# Altium schematic sheet [05] - FLASH MEMORY INTERFACE.SchDoc
size A2; DocumentNumber: 2; SheetNumber: 5; SheetTotal: 10
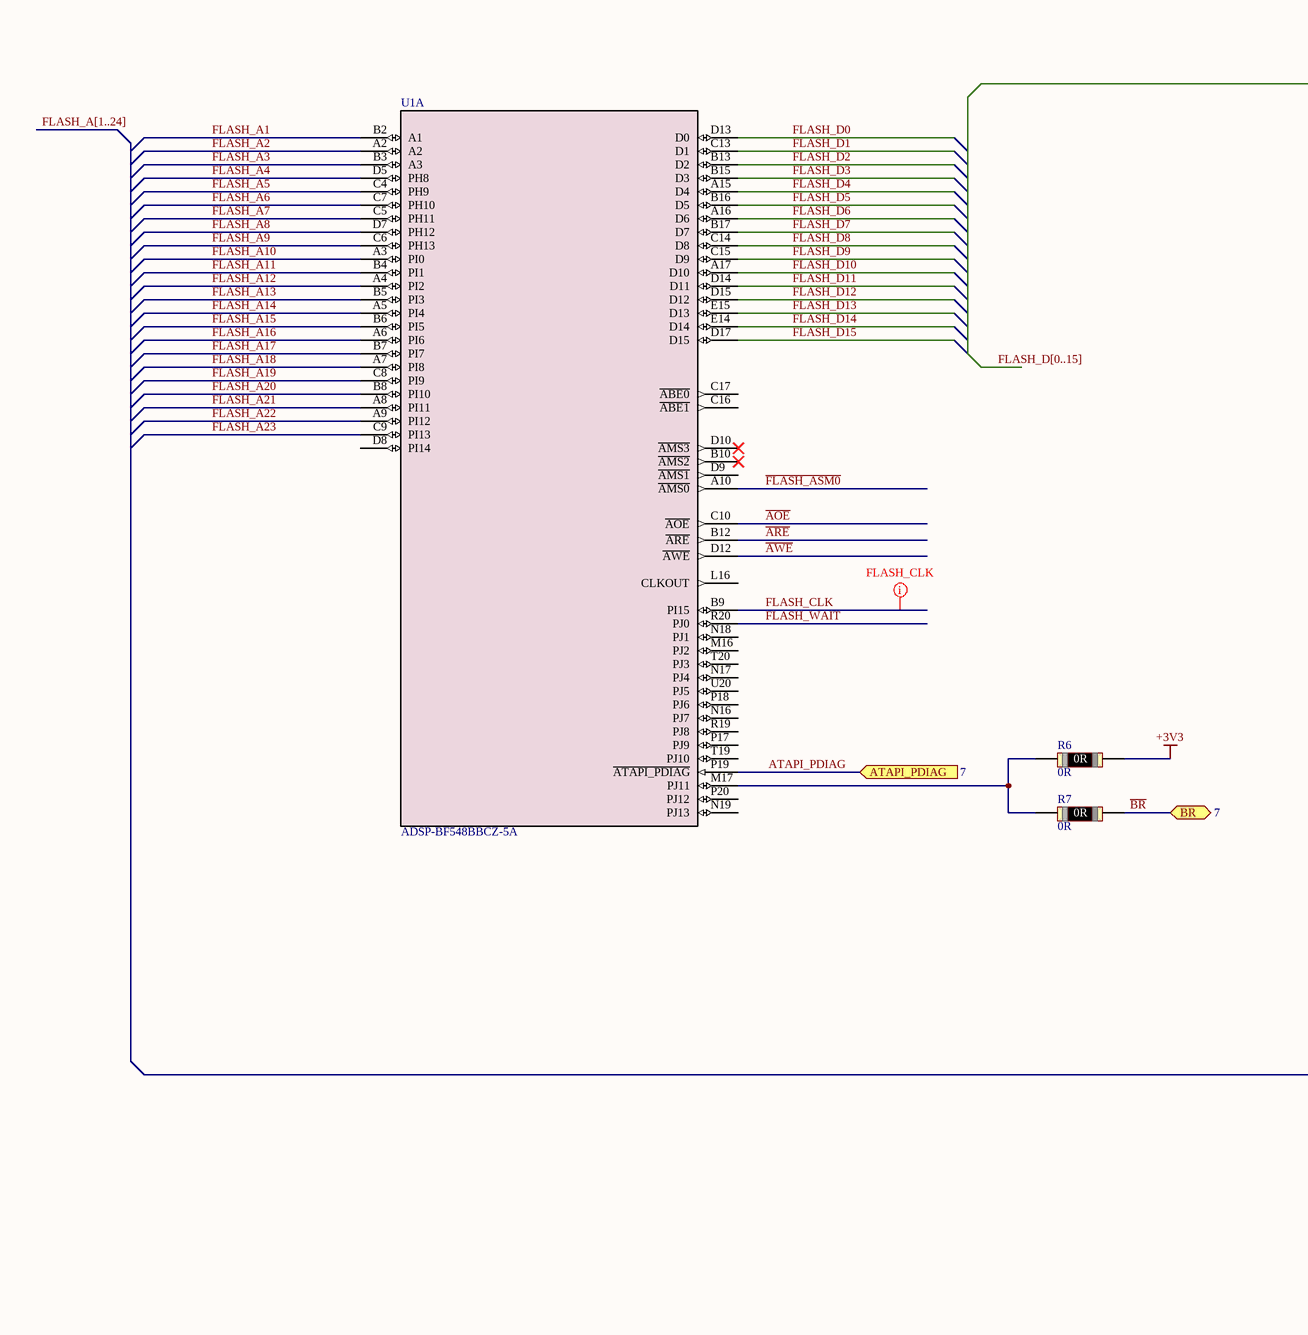
[diagram p0: [05] - FLASH MEMORY INTERFACE.SchDoc, left]
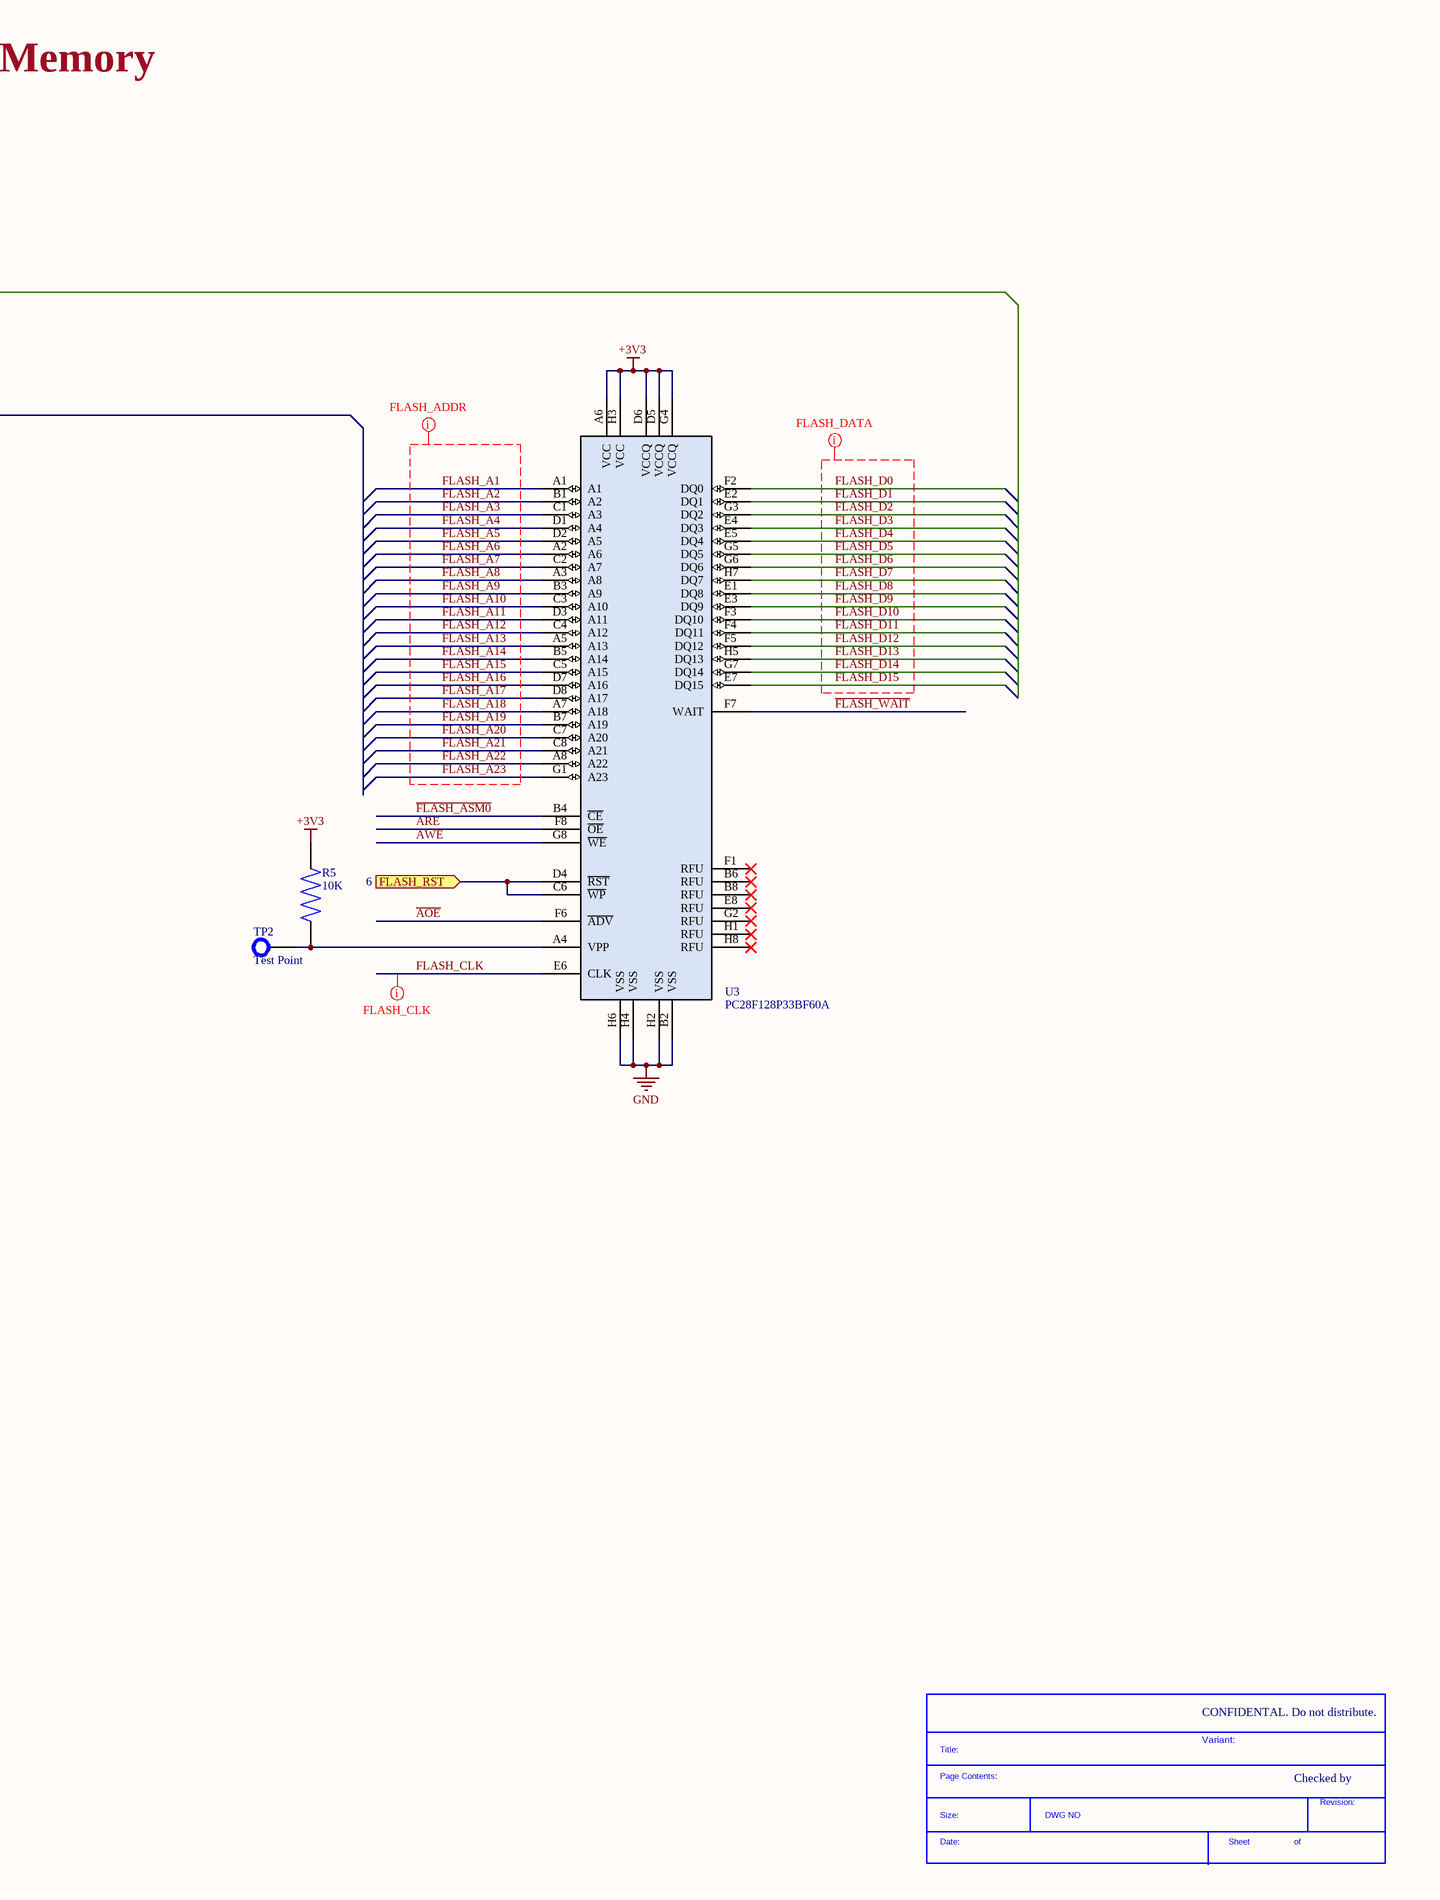
[diagram p1: [05] - FLASH MEMORY INTERFACE.SchDoc, right]

## Parts
*  SDTitleBlock  (value not drawn)  (graphical)
R5  10K  [RES0402]
R6  0R  [RES0402]
R7  0R  [RES0402]
TP2  Test Point  [TP_70MIL]
U1  ADSP-BF548BBCZ-5A  [BC_400_1_ADI]  (part A of 7)
U3  PC28F128P33BF60A  [BGA64_8X10_MRN]

## Ports
ATAPI_PDIAG (in, see 7), BR (bidir, see 7), FLASH_RST (in, see 6)

## Nets
+3V3: R5.2 R6.2 U3.A6(VCC) U3.D5(VCCQ) U3.D6(VCCQ) U3.G4(VCCQ) U3.H3(VCC)
GND: U3.B2(VSS) U3.H2(VSS) U3.H4(VSS) U3.H6(VSS)
~{AOE}: U1.C10(~{AOE}) U3.F6(~{ADV})
~{ARE}: U1.B12(~{ARE}) U3.F8(~{OE})
~{AWE}: U1.D12(~{AWE}) U3.G8(~{WE})
ATAPI_PDIAG: U1.P19(~{ATAPI_PDIAG}) ; port ATAPI_PDIAG
~{BR}: R7.2 ; port BR
~{FLASH_ASM0}: U1.A10(~{AMS0}) U3.B4(~{CE})
~{FLASH_WAIT}: U1.R20(PJ0) U3.F7(WAIT)
FLASH_A1: U1.B2(A1) U3.A1
FLASH_A2: U1.A2 U3.B1(A2)
FLASH_A3: U1.B3(A3) U3.C1(A3)
FLASH_A4: U1.D5(PH8) U3.D1(A4)
FLASH_A5: U1.C4(PH9) U3.D2(A5)
FLASH_A6: U1.C7(PH10) U3.A2(A6)
FLASH_A7: U1.C5(PH11) U3.C2(A7)
FLASH_A8: U1.D7(PH12) U3.A3(A8)
FLASH_A9: U1.C6(PH13) U3.B3(A9)
FLASH_A10: U1.A3(PI0) U3.C3(A10)
FLASH_A11: U1.B4(PI1) U3.D3(A11)
FLASH_A12: U1.A4(PI2) U3.C4(A12)
FLASH_A13: U1.B5(PI3) U3.A5(A13)
FLASH_A14: U1.A5(PI4) U3.B5(A14)
FLASH_A15: U1.B6(PI5) U3.C5(A15)
FLASH_A16: U1.A6(PI6) U3.D7(A16)
FLASH_A17: U1.B7(PI7) U3.D8(A17)
FLASH_A18: U1.A7(PI8) U3.A7(A18)
FLASH_A19: U1.C8(PI9) U3.B7(A19)
FLASH_A20: U1.B8(PI10) U3.C7(A20)
FLASH_A21: U1.A8(PI11) U3.C8(A21)
FLASH_A22: U1.A9(PI12) U3.A8(A22)
FLASH_A23: U1.C9(PI13) U3.G1(A23)
FLASH_CLK: U1.B9(PI15) U3.E6(CLK)
FLASH_D0: U1.D13(D0) U3.F2(DQ0)
FLASH_D1: U1.C13(D1) U3.E2(DQ1)
FLASH_D2: U1.B13(D2) U3.G3(DQ2)
FLASH_D3: U1.B15(D3) U3.E4(DQ3)
FLASH_D4: U1.A15(D4) U3.E5(DQ4)
FLASH_D5: U1.B16(D5) U3.G5(DQ5)
FLASH_D6: U1.A16(D6) U3.G6(DQ6)
FLASH_D7: U1.B17(D7) U3.H7(DQ7)
FLASH_D8: U1.C14(D8) U3.E1(DQ8)
FLASH_D9: U1.C15(D9) U3.E3(DQ9)
FLASH_D10: U1.A17(D10) U3.F3(DQ10)
FLASH_D11: U1.D14(D11) U3.F4(DQ11)
FLASH_D12: U1.D15(D12) U3.F5(DQ12)
FLASH_D13: U1.E15(D13) U3.H5(DQ13)
FLASH_D14: U1.E14(D14) U3.G7(DQ14)
FLASH_D15: U1.D17(D15) U3.E7(DQ15)
FLASH_RST: U3.C6(~{WP}) U3.D4(~{RST}) ; port FLASH_RST
NetR5_1: R5.1 TP2.0 U3.A4(VPP)
NetR6_1: R6.1 R7.1 U1.M17(PJ11)

Not connected (* = marked no-connect by the designer): U1 B10(~{AMS2})* C16(~{ABE1}) C17(~{ABE0}) D8(PI14) D9(~{AMS1}) D10(~{AMS3})* L16(CLKOUT) M16(PJ2) N16(PJ7) N17(PJ4) N18(PJ1) N19(PJ13) P17(PJ9) P18(PJ6) P20(PJ12) R19(PJ8) T19(PJ10) T20(PJ3) U20(PJ5); U3 B6(RFU)* B8(RFU)* E8(RFU)* F1(RFU)* G2(RFU)* H1(RFU)* H8(RFU)*

## Buses and harness runs
bus FLASH_A[1..24]
bus FLASH_D[0..15]

## Layout directives
net class FLASH_ADDR: FLASH_A1, FLASH_A2, FLASH_A3, FLASH_A4, FLASH_A5, FLASH_A6, FLASH_A7, FLASH_A8, FLASH_A9, FLASH_A10, FLASH_A11, FLASH_A12, FLASH_A13, FLASH_A14, FLASH_A15, FLASH_A16, FLASH_A17, FLASH_A18, FLASH_A19, FLASH_A20, FLASH_A21, FLASH_A22, FLASH_A23
net class FLASH_DATA: FLASH_D0, FLASH_D1, FLASH_D2, FLASH_D3, FLASH_D4, FLASH_D5, FLASH_D6, FLASH_D7, FLASH_D8, FLASH_D9, FLASH_D10, FLASH_D11, FLASH_D12, FLASH_D13, FLASH_D14, FLASH_D15
net class FLASH_CLK: FLASH_CLK
mark named FLASH_CLK: FLASH_CLK

## Notes on the sheet
- Flash Memory
- CLOCKS (CPU & PCIE)
- CONFIDENTAL. Do not distribute.
- Variant:
- Checked by
- (in symbol SDTitleBlock) Title:; Page Contents:; Revision:; Size:; DWG NO; Date:; Sheet; of

## Library data of the parts
R5 = CRCW040210K0FHEDP: 10 kOhms ±1% 0.063W, 1/16W Chip Resistor 0402 (1005 Metric) Automotive AEC-Q200 Thick Film; Manufacturer: Vishay Dale; Digi-Key Part Number: CRCW040210K0FHEDP-ND; Manufacturer Product Number: CRCW040210K0FHEDP; Supplier: Vishay Dale; Package / Case: 0402; Resistance: 10K
R6 R7 = RC0402FR-070RL: 0 Ohms Jumper 0.063W, 1/16W Chip Resistor 0402 (1005 Metric)  Thick Film; Manufacturer: Yageo; Digi-Key Part Number: 311-0.0LRTR-ND; Manufacturer Product Number: RC0402FR-070RL; Supplier: Yageo; Package / Case: 0402; Resistance: 0R
TP2 = TP
U1 = ADSP-BF548BBCZ-5A: IC DSP 16BIT 533MHZ 400CSBGA; Manufacturer: Analog Devices Inc.; Manufacturer_Part_Number: ADSP-BF548BBCZ-5A; Supplier: Analog Devices Inc.; Manufacturer Product Number: ADSP-BF548BBCZ-5A; TypeDigi-Key Part Number: ADSP-BF548BBCZ-5A-ND
U3 = PC28F128P33BF60A: FLASH - NOR Memory IC 128Mb (8M x 16) Parallel 52MHz 60ns 64-EasyBGA (10x13); Manufacturer: Alliance Memory, Inc.; Digi-Key Part Number: D:\embedded_systems\Projects\Pievision\BLACKFIN-SOM\Design; Manufacturer Product Number: PC28F128P33BF60A; Supplier: Alliance Memory, Inc.; Series: StrataFlash; Package / Case: 64-TBGA